# Altium schematic sheet Main.SchDoc: Плата
size 594 x 420 mm; CompanyName: ООО "ЛАССАРД"; Address1: Address1; Address2: Address2; Address3: Address3; Address4: Address4; DocumentNumber: *Э3; SheetNumber: 1; SheetTotal: 11; Title2str: управления; DocumentType: Схема электрическая принципиальная
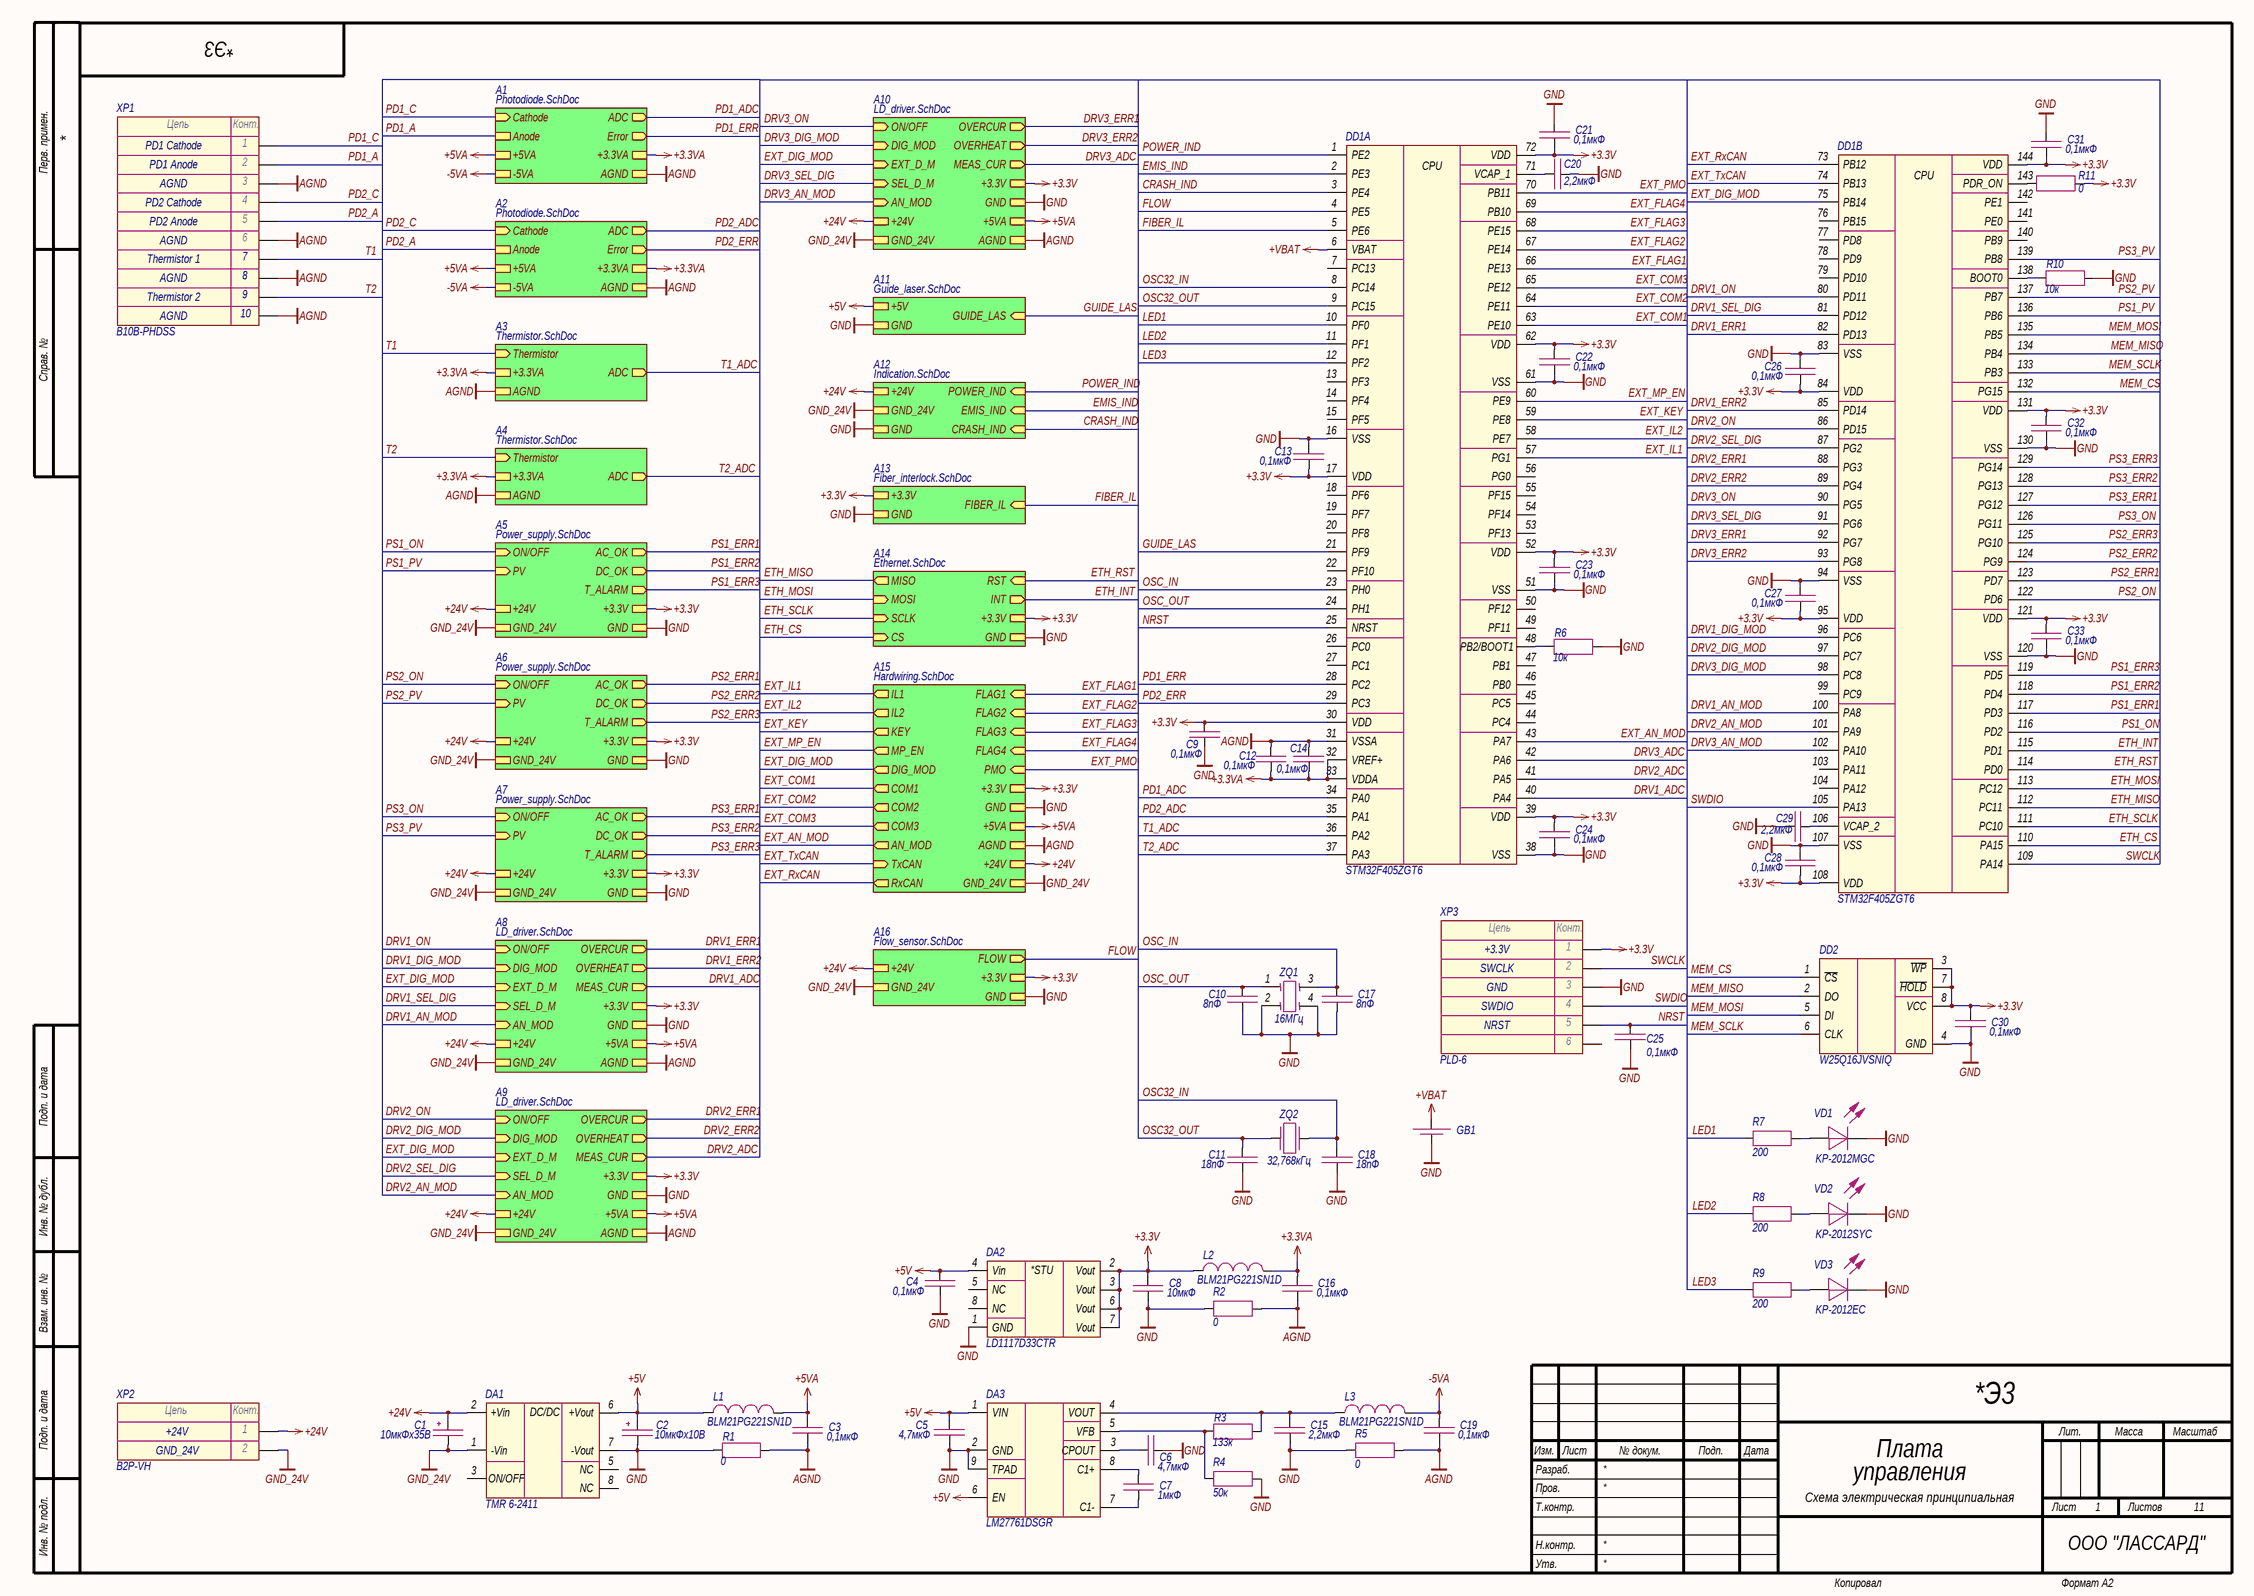
[diagram p0: Main.SchDoc]

## Parts
C1  10мкФх35B  [CAP_C]
C2  10мкФх10B  [CAP_A]
C3  0,1мкФ  [CAP_0603]
C4  0,1мкФ  [CAP_0603]
C5  4,7мкФ  [CAP_0603]
C6  4,7мкФ  [CAP_0603]
C7  1мкФ  [CAP_0603]
C8  10мкФ  [CAP_0603]
C9  0,1мкФ  [CAP_0603]
C10  8пФ  [CAP_0603]
C11  18пФ  [CAP_0603]
C12  0,1мкФ  [CAP_0603]
C13  0,1мкФ  [CAP_0603]
C14  0,1мкФ  [CAP_0603]
C15  2,2мкФ  [CAP_0603]
C16  0,1мкФ  [CAP_0603]
C17  8пФ  [CAP_0603]
C18  18пФ  [CAP_0603]
C19  0,1мкФ  [CAP_0603]
C20  2,2мкФ  [CAP_0603]
C21  0,1мкФ  [CAP_0603]
C22  0,1мкФ  [CAP_0603]
C23  0,1мкФ  [CAP_0603]
C24  0,1мкФ  [CAP_0603]
C25  0,1мкФ  [CAP_0603]
C26  0,1мкФ  [CAP_0603]
C27  0,1мкФ  [CAP_0603]
C28  0,1мкФ  [CAP_0603]
C29  2,2мкФ  [CAP_0603]
C30  0,1мкФ  [CAP_0603]
C31  0,1мкФ  [CAP_0603]
C32  0,1мкФ  [CAP_0603]
C33  0,1мкФ  [CAP_0603]
DA1  TMR 6-2411  [TMR3 (SIP-8)]
DA2  LD1117D33CTR  [SOIC-8]
DA3  LM27761DSGR  [WSON-8]
DD1  STM32F405ZGT6  [LQFP-144]  (parts A,B of 2)
DD2  W25Q16JVSNIQ  [SOIC-8]
GB1  DS1092-12-N8S  [DS1092-12-N8S]  (value not drawn)
L1  BLM21PG221SN1D  [IND_0805]
L2  BLM21PG221SN1D  [IND_0805]
L3  BLM21PG221SN1D  [IND_0805]
R1  0  [RES_0805]
R2  0  [RES_0805]
R3  133к  [RES_0603]
R4  50к  [RES_0603]
R5  0  [RES_0805]
R6  10к  [RES_0603]
R7  200  [RES_0603]
R8  200  [RES_0603]
R9  200  [RES_0603]
R10  10к  [RES_0603]
R11  0  [RES_0603]
VD1  KP-2012MGC  [LED_0805]
VD2  KP-2012SYC  [LED_0805]
VD3  KP-2012EC  [LED_0805]
XP1  B10B-PHDSS  [B10B-PHDSS]
XP2  B2P-VH  [B2P-VH]
XP3  PLD-6  [PLD-6]
ZQ1  16МГц  [NX2520SA]
ZQ2  32,768кГц  [NX3215SA]

## Sub-sheets
A1 = Photodiode.SchDoc: Cathode (in), ADC (out), Error (out), AGND, +5VA, +3.3VA, -5VA, Anode
A2 = Photodiode.SchDoc: Cathode (in), ADC (out), Error (out), AGND, +5VA, +3.3VA, -5VA, Anode
A3 = Thermistor.SchDoc: Thermistor (in), +3.3VA, AGND, ADC (out)
A4 = Thermistor.SchDoc: Thermistor (in), +3.3VA, AGND, ADC (out)
A5 = Power_supply.SchDoc: ON/OFF (in), PV (in), +3.3V, GND, +24V, GND_24V, AC_OK (out), DC_OK (out), T_ALARM (out)
A6 = Power_supply.SchDoc: ON/OFF (in), PV (in), +3.3V, GND, +24V, GND_24V, AC_OK (out), DC_OK (out), T_ALARM (out)
A7 = Power_supply.SchDoc: ON/OFF (in), PV (in), +3.3V, GND, +24V, GND_24V, AC_OK (out), DC_OK (out), T_ALARM (out)
A8 = LD_driver.SchDoc: +3.3V, GND, OVERCUR (out), OVERHEAT (out), +24V, GND_24V, ON/OFF (in), DIG_MOD (in), AN_MOD (in), MEAS_CUR (out), +5VA, AGND, EXT_D_M (in), SEL_D_M (in)
A9 = LD_driver.SchDoc: +3.3V, GND, OVERCUR (out), OVERHEAT (out), +24V, GND_24V, ON/OFF (in), DIG_MOD (in), AN_MOD (in), MEAS_CUR (out), +5VA, AGND, EXT_D_M (in), SEL_D_M (in)
A10 = LD_driver.SchDoc: +3.3V, GND, OVERCUR (out), OVERHEAT (out), +24V, GND_24V, ON/OFF (in), DIG_MOD (in), AN_MOD (in), MEAS_CUR (out), +5VA, AGND, EXT_D_M (in), SEL_D_M (in)
A11 = Guide_laser.SchDoc: GUIDE_LAS (in), +5V, GND
A12 = Indication.SchDoc: GND_24V, +24V, CRASH_IND (in), POWER_IND (in), EMIS_IND (in), GND
A13 = Fiber_interlock.SchDoc: FIBER_IL (in), +3.3V, GND
A14 = Ethernet.SchDoc: MISO (out), RST (in), MOSI (in), INT (out), SCLK (in), CS (in), +3.3V, GND
A15 = Hardwiring.SchDoc: IL1 (out), FLAG1 (in), IL2 (out), KEY (out), MP_EN (out), AN_MOD (out), FLAG2 (in), FLAG3 (in), FLAG4 (in), PMO (in), COM1 (out), COM2 (out), COM3 (out), DIG_MOD (out), AGND, +3.3V, GND, GND_24V, +24V, +5VA, RxCAN (out), TxCAN (in)
A16 = Flow_sensor.SchDoc: FLOW (out), +24V, GND_24V, +3.3V, GND

## Nets
+3.3V: C8.1 C9.1 C13.2 C21.2 C22.1 C23.1 C24.1 C26.2 C27.2 C28.2 C30.1 C31.2 C32.1 C33.1 DA2.2(Vout) DA2.3(Vout) DA2.6(Vout) DA2.7(Vout) DD1.17(VDD) DD1.30(VDD) DD1.39(VDD) DD1.52(VDD) DD1.62(VDD) DD1.72(VDD) DD1.84(VDD) DD1.95(VDD) DD1.108(VDD) DD1.121(VDD) DD1.131(VDD) DD1.144(VDD) DD2.3(~{WP}) DD2.7(~{HOLD}) DD2.8(VCC) L2.1 R11.2 XP3.1 ; sheet A8/+3.3V, sheet A9/+3.3V, sheet A5/+3.3V, sheet A6/+3.3V, sheet A7/+3.3V, sheet A15/+3.3V, sheet A14/+3.3V, sheet A13/+3.3V, sheet A16/+3.3V, sheet A10/+3.3V
+3.3VA: C12.2 C14.2 C16.1 DD1.32(VREF+) DD1.33(VDDA) L2.2 ; sheet A1/+3.3VA, sheet A3/+3.3VA, sheet A2/+3.3VA, sheet A4/+3.3VA
+5V: C2.1 C4.2 C5.1 DA1.6(+Vout) DA2.4(Vin) DA3.1(VIN) DA3.6(EN) L1.1 ; sheet A11/+5V
+5VA: C3.1 L1.2 ; sheet A1/+5VA, sheet A2/+5VA, sheet A8/+5VA, sheet A9/+5VA, sheet A15/+5VA, sheet A10/+5VA
+24V: C1.1 DA1.2(+Vin) XP2.1 ; sheet A8/+24V, sheet A9/+24V, sheet A5/+24V, sheet A6/+24V, sheet A7/+24V, sheet A12/+24V, sheet A15/+24V, sheet A16/+24V, sheet A10/+24V
+VBAT: DD1.6(VBAT) GB1.2
-5VA: C19.1 L3.2 ; sheet A1/-5VA, sheet A2/-5VA
AGND: C3.2 C12.1 C14.1 C16.2 C19.2 DD1.31(VSSA) R1.2 R2.2 R5.2 XP1.3 XP1.6 XP1.8 XP1.10 ; sheet A1/AGND, sheet A3/AGND, sheet A2/AGND, sheet A4/AGND, sheet A8/AGND, sheet A9/AGND, sheet A15/AGND, sheet A10/AGND
GND: C2.2 C4.1 C5.2 C6.2 C8.2 C9.2 C10.2 C11.2 C13.1 C15.2 C17.2 C18.2 C20.2 C21.1 C22.2 C23.2 C24.2 C25.2 C26.1 C27.1 C28.1 C29.2 C30.2 C31.1 C32.2 C33.2 DA1.7(-Vout) DA2.1(GND) DA3.2(GND) DA3.9(TPAD) DD1.16(VSS) DD1.38(VSS) DD1.51(VSS) DD1.61(VSS) DD1.83(VSS) DD1.94(VSS) DD1.107(VSS) DD1.120(VSS) DD1.130(VSS) DD2.4(GND) GB1.1 R1.1 R2.1 R4.1 R5.1 R6.2 R10.2 VD1.2(C) VD2.2(C) VD3.2(C) XP3.3 ZQ1.2 ZQ1.4 ; sheet A8/GND, sheet A9/GND, sheet A5/GND, sheet A6/GND, sheet A7/GND, sheet A12/GND, sheet A15/GND, sheet A14/GND, sheet A11/GND, sheet A13/GND, sheet A16/GND, sheet A10/GND
GND_24V: C1.2 DA1.1(-Vin) XP2.2 ; sheet A8/GND_24V, sheet A9/GND_24V, sheet A5/GND_24V, sheet A6/GND_24V, sheet A7/GND_24V, sheet A12/GND_24V, sheet A15/GND_24V, sheet A16/GND_24V, sheet A10/GND_24V
CRASH_IND: DD1.3(PE4) ; sheet A12/CRASH_IND
DRV1_ADC: DD1.40(PA4) ; sheet A8/MEAS_CUR
DRV1_AN_MOD: DD1.100(PA8) ; sheet A8/AN_MOD
DRV1_DIG_MOD: DD1.96(PC6) ; sheet A8/DIG_MOD
DRV1_ERR1: DD1.82(PD13) ; sheet A8/OVERCUR
DRV1_ERR2: DD1.85(PD14) ; sheet A8/OVERHEAT
DRV1_ON: DD1.80(PD11) ; sheet A8/ON/OFF
DRV1_SEL_DIG: DD1.81(PD12) ; sheet A8/SEL_D_M
DRV2_ADC: DD1.41(PA5) ; sheet A9/MEAS_CUR
DRV2_AN_MOD: DD1.101(PA9) ; sheet A9/AN_MOD
DRV2_DIG_MOD: DD1.97(PC7) ; sheet A9/DIG_MOD
DRV2_ERR1: DD1.88(PG3) ; sheet A9/OVERCUR
DRV2_ERR2: DD1.89(PG4) ; sheet A9/OVERHEAT
DRV2_ON: DD1.86(PD15) ; sheet A9/ON/OFF
DRV2_SEL_DIG: DD1.87(PG2) ; sheet A9/SEL_D_M
DRV3_ADC: DD1.42(PA6) ; sheet A10/MEAS_CUR
DRV3_AN_MOD: DD1.102(PA10) ; sheet A10/AN_MOD
DRV3_DIG_MOD: DD1.98(PC8) ; sheet A10/DIG_MOD
DRV3_ERR1: DD1.92(PG7) ; sheet A10/OVERCUR
DRV3_ERR2: DD1.93(PG8) ; sheet A10/OVERHEAT
DRV3_ON: DD1.90(PG5) ; sheet A10/ON/OFF
DRV3_SEL_DIG: DD1.91(PG6) ; sheet A10/SEL_D_M
EMIS_IND: DD1.2(PE3) ; sheet A12/EMIS_IND
ETH_CS: DD1.110(PA15) ; sheet A14/CS
ETH_INT: DD1.115(PD1) ; sheet A14/INT
ETH_MISO: DD1.112(PC11) ; sheet A14/MISO
ETH_MOSI: DD1.113(PC12) ; sheet A14/MOSI
ETH_RST: DD1.114(PD0) ; sheet A14/RST
ETH_SCLK: DD1.111(PC10) ; sheet A14/SCLK
EXT_AN_MOD: DD1.43(PA7) ; sheet A15/AN_MOD
EXT_COM1: DD1.63(PE10) ; sheet A15/COM1
EXT_COM2: DD1.64(PE11) ; sheet A15/COM2
EXT_COM3: DD1.65(PE12) ; sheet A15/COM3
EXT_DIG_MOD: DD1.75(PB14) ; sheet A8/EXT_D_M, sheet A9/EXT_D_M, sheet A15/DIG_MOD, sheet A10/EXT_D_M
EXT_FLAG1: DD1.66(PE13) ; sheet A15/FLAG1
EXT_FLAG2: DD1.67(PE14) ; sheet A15/FLAG2
EXT_FLAG3: DD1.68(PE15) ; sheet A15/FLAG3
EXT_FLAG4: DD1.69(PB10) ; sheet A15/FLAG4
EXT_IL1: DD1.57(PG1) ; sheet A15/IL1
EXT_IL2: DD1.58(PE7) ; sheet A15/IL2
EXT_KEY: DD1.59(PE8) ; sheet A15/KEY
EXT_MP_EN: DD1.60(PE9) ; sheet A15/MP_EN
EXT_PMO: DD1.70(PB11) ; sheet A15/PMO
EXT_RxCAN: DD1.73(PB12) ; sheet A15/RxCAN
EXT_TxCAN: DD1.74(PB13) ; sheet A15/TxCAN
FIBER_IL: DD1.5(PE6) ; sheet A13/FIBER_IL
FLOW: DD1.4(PE5) ; sheet A16/FLOW
GUIDE_LAS: DD1.21(PF9) ; sheet A11/GUIDE_LAS
LED1: DD1.10(PF0) R7.1
LED2: DD1.11(PF1) R8.1
LED3: DD1.12(PF2) R9.1
MEM_CS: DD1.132(PG15) DD2.1(~{CS})
MEM_MISO: DD1.134(PB4) DD2.2(DO)
MEM_MOSI: DD1.135(PB5) DD2.5(DI)
MEM_SCLK: DD1.133(PB3) DD2.6(CLK)
NRST: C25.1 DD1.25(NRST) XP3.5
OSC32_IN: C18.1 DD1.8(PC14) ZQ2.2
OSC32_OUT: C11.1 DD1.9(PC15) ZQ2.1
OSC_IN: C17.1 DD1.23(PH0) ZQ1.3
OSC_OUT: C10.1 DD1.24(PH1) ZQ1.1
PD1_A: XP1.2 ; sheet A1/Anode
PD1_ADC: DD1.34(PA0) ; sheet A1/ADC
PD1_C: XP1.1 ; sheet A1/Cathode
PD1_ERR: DD1.28(PC2) ; sheet A1/Error
PD2_A: XP1.5 ; sheet A2/Anode
PD2_ADC: DD1.35(PA1) ; sheet A2/ADC
PD2_C: XP1.4 ; sheet A2/Cathode
PD2_ERR: DD1.29(PC3) ; sheet A2/Error
POWER_IND: DD1.1(PE2) ; sheet A12/POWER_IND
PS1_ERR1: DD1.117(PD3) ; sheet A5/AC_OK
PS1_ERR2: DD1.118(PD4) ; sheet A5/DC_OK
PS1_ERR3: DD1.119(PD5) ; sheet A5/T_ALARM
PS1_ON: DD1.116(PD2) ; sheet A5/ON/OFF
PS1_PV: DD1.136(PB6) ; sheet A5/PV
PS2_ERR1: DD1.123(PD7) ; sheet A6/AC_OK
PS2_ERR2: DD1.124(PG9) ; sheet A6/DC_OK
PS2_ERR3: DD1.125(PG10) ; sheet A6/T_ALARM
PS2_ON: DD1.122(PD6) ; sheet A6/ON/OFF
PS2_PV: DD1.137(PB7) ; sheet A6/PV
PS3_ERR1: DD1.127(PG12) ; sheet A7/AC_OK
PS3_ERR2: DD1.128(PG13) ; sheet A7/DC_OK
PS3_ERR3: DD1.129(PG14) ; sheet A7/T_ALARM
PS3_ON: DD1.126(PG11) ; sheet A7/ON/OFF
PS3_PV: DD1.139(PB8) ; sheet A7/PV
SWCLK: DD1.109(PA14) XP3.2
SWDIO: DD1.105(PA13) XP3.4
T1: XP1.7 ; sheet A3/Thermistor
T1_ADC: DD1.36(PA2) ; sheet A3/ADC
T2: XP1.9 ; sheet A4/Thermistor
T2_ADC: DD1.37(PA3) ; sheet A4/ADC
NetC6_1: C6.1 DA3.3(CPOUT)
NetC7_1: C7.1 DA3.8(C1+)
NetC7_2: C7.2 DA3.7(C1-)
NetC15_1: C15.1 DA3.4(VOUT) L3.1 R3.2
NetC20_1: C20.1 DD1.71(VCAP_1)
NetC29_1: C29.1 DD1.106(VCAP_2)
NetDA3_5: DA3.5(VFB) R3.1 R4.2
NetDD1_48: DD1.48(PB2/BOOT1) R6.1
NetDD1_138: DD1.138(BOOT0) R10.1
NetDD1_143: DD1.143(PDR_ON) R11.1
NetR7_2: R7.2 VD1.1(A)
NetR8_2: R8.2 VD2.1(A)
NetR9_2: R9.2 VD3.1(A)

Not connected (* = marked no-connect by the designer): DA1 3(ON/OFF) 5(NC) 8(NC); DA2 5(NC) 8(NC); DD1 7(PC13) 13(PF3) 14(PF4) 15(PF5) 18(PF6) 19(PF7) 20(PF8) 22(PF10) 26(PC0) 27(PC1) 44(PC4) 45(PC5) 46(PB0) 47(PB1) 49(PF11) 50(PF12) 53(PF13) 54(PF14) 55(PF15) 56(PG0) 76(PB15) 77(PD8) 78(PD9) 79(PD10) 99(PC9) 103(PA11) 104(PA12) 140(PB9) 141(PE0) 142(PE1); XP3 6

## Notes on the sheet
- PD1 Cathode
- PD1 Anode
- PD2 Anode
- AGND
- PD2 Cathode
- Thermistor 1
- Thermistor 2
- GND
- +3.3V
- SWCLK
- SWDIO
- NRST
- +24V
- GND_24V
- Перв. примен.
- Справ. №
- Подп. и дата
- Инв. № дубл.
- Взам. инв. №
- Разраб.
- Изм.
- Лист
- № докум.
- Подп.
- Дата
- Лит.
- Масса
- Масштаб
- Пров.
- Т.контр.
- Листов
- Инв. № подл.
- Утв.
- Н.контр.
- Копировал
- Формат А2
- (in symbol Connector-2) Цепь; Конт.
- (in symbol Connector-6) Цепь; Конт.
- (in symbol Connector-10) Цепь; Конт.
- (in symbol LD1117D33) *STU
- (in symbol STM32F405ZG, part A) CPU
- (in symbol STM32F405ZG, part B) CPU
- (in symbol TMR3) DC/DC

## Library data of the parts
C1 = Capacitor_Polar: Model: TECAP, 10 мкФ, 35 В, тип C, 10%; Value: 10мкФх35B; Document: *; Manufacturer: *
C2 = Capacitor_Polar: Model: TECAP, 10 мкФ, 10 В, тип A, 10%; Value: 10мкФх10B; Document: *; Manufacturer: *
C3 C4 C9 C12-C14 C16 C19 C21-C28 C30-C33 = Capacitor: Manufacturer: Murata; Model: GRM188R71H104KA93D; Value: 0,1мкФ; Document: *
C5 C6 = Capacitor: Manufacturer: Murata; Model: GRM188R6YA475KE15D; Value: 4,7мкФ; Document: *
C7 = Capacitor: Manufacturer: Murata; Model: GRM188R61H105KAALD; Value: 1мкФ; Document: *
C8 = Capacitor: Manufacturer: Murata; Model: GRM188R61E106KA73D; Value: 10мкФ; Document: *
C10 C17 = Capacitor: Manufacturer: Yageo; Model: CC0603CRNPO9BN8R0; Value: 8пФ; Document: *
C11 C18 = Capacitor: Manufacturer: Murata; Model: GRM1885C1H180FA01D; Value: 18пФ; Document: *
C15 C20 C29 = Capacitor: Manufacturer: Murata; Model: GRM188R61H225KE11D; Value: 2,2мкФ; Document: *
DA1 = TMR3: Manufacturer: Traco Power; Model: TMR 6-2411; Document: *
DA2 = LD1117D33: Manufacturer: STMicroelectronics; Model: LD1117D33CTR; Document: *
DA3 = LM27761: Manufacturer: Texas Instruments; Model: LM27761DSGR; Document: *
DD1 = STM32F405ZG: Manufacturer: STMicroelectronics; Model: STM32F405ZGT6; Document: *
DD2 = W25Q: Manufacturer: Winbond; Model: W25Q16JVSNIQ; Document: *
GB1 = Accumulator: Manufacturer: Connfly; Model: DS1092-12-N8S; Document: *
L1-L3 = Inductor: Manufacturer: Murata; Value: *; Model: BLM21PG221SN1D; Document: *
R1 R2 R5 = Resistor: Manufacturer: Yageo; Model: RC0805FR-070RL; Value: 0; Document: *
R3 = Resistor: Manufacturer: Yageo; Model: RC0603FR-07133KL; Value: 133к; Document: *
R4 = Resistor: Manufacturer: Yageo; Model: RT0603BRD0750KL; Value: 50к; Document: *
R6 R10 = Resistor: Manufacturer: Yageo; Model: RC0603FR-0710KL; Value: 10к; Document: *
R7-R9 = Resistor: Manufacturer: Yageo; Model: RC0603FR-07200RL; Value: 200; Document: *
R11 = Resistor: Manufacturer: Yageo; Model: RC0603FR-070RL; Value: 0; Document: *
VD1-VD3 = LED: Manufacturer: Kingbright; Document: *
  VD1: Model: KP-2012MGC
  VD2: Model: KP-2012SYC
  VD3: Model: KP-2012EC
XP1 = Connector-10: Manufacturer: JST; Model: B10B-PHDSS; Document: *
XP2 = Connector-2: Manufacturer: JST; Model: B2P-VH; Document: *
XP3 = Connector-6: Manufacturer: Connfly; Model: PLD-6; Document: *
ZQ1 = Quartz_Resonator_4-pin: Manufacturer: NDK; Model: NX2520SA-16MHZ-STD-CSW-5; Value: 16МГц; Document: *
ZQ2 = Quartz_Resonator: Manufacturer: NDK; Model: NX3215SA- 32.768K-STD-MUA-8; Value: 32,768кГц; Document: *